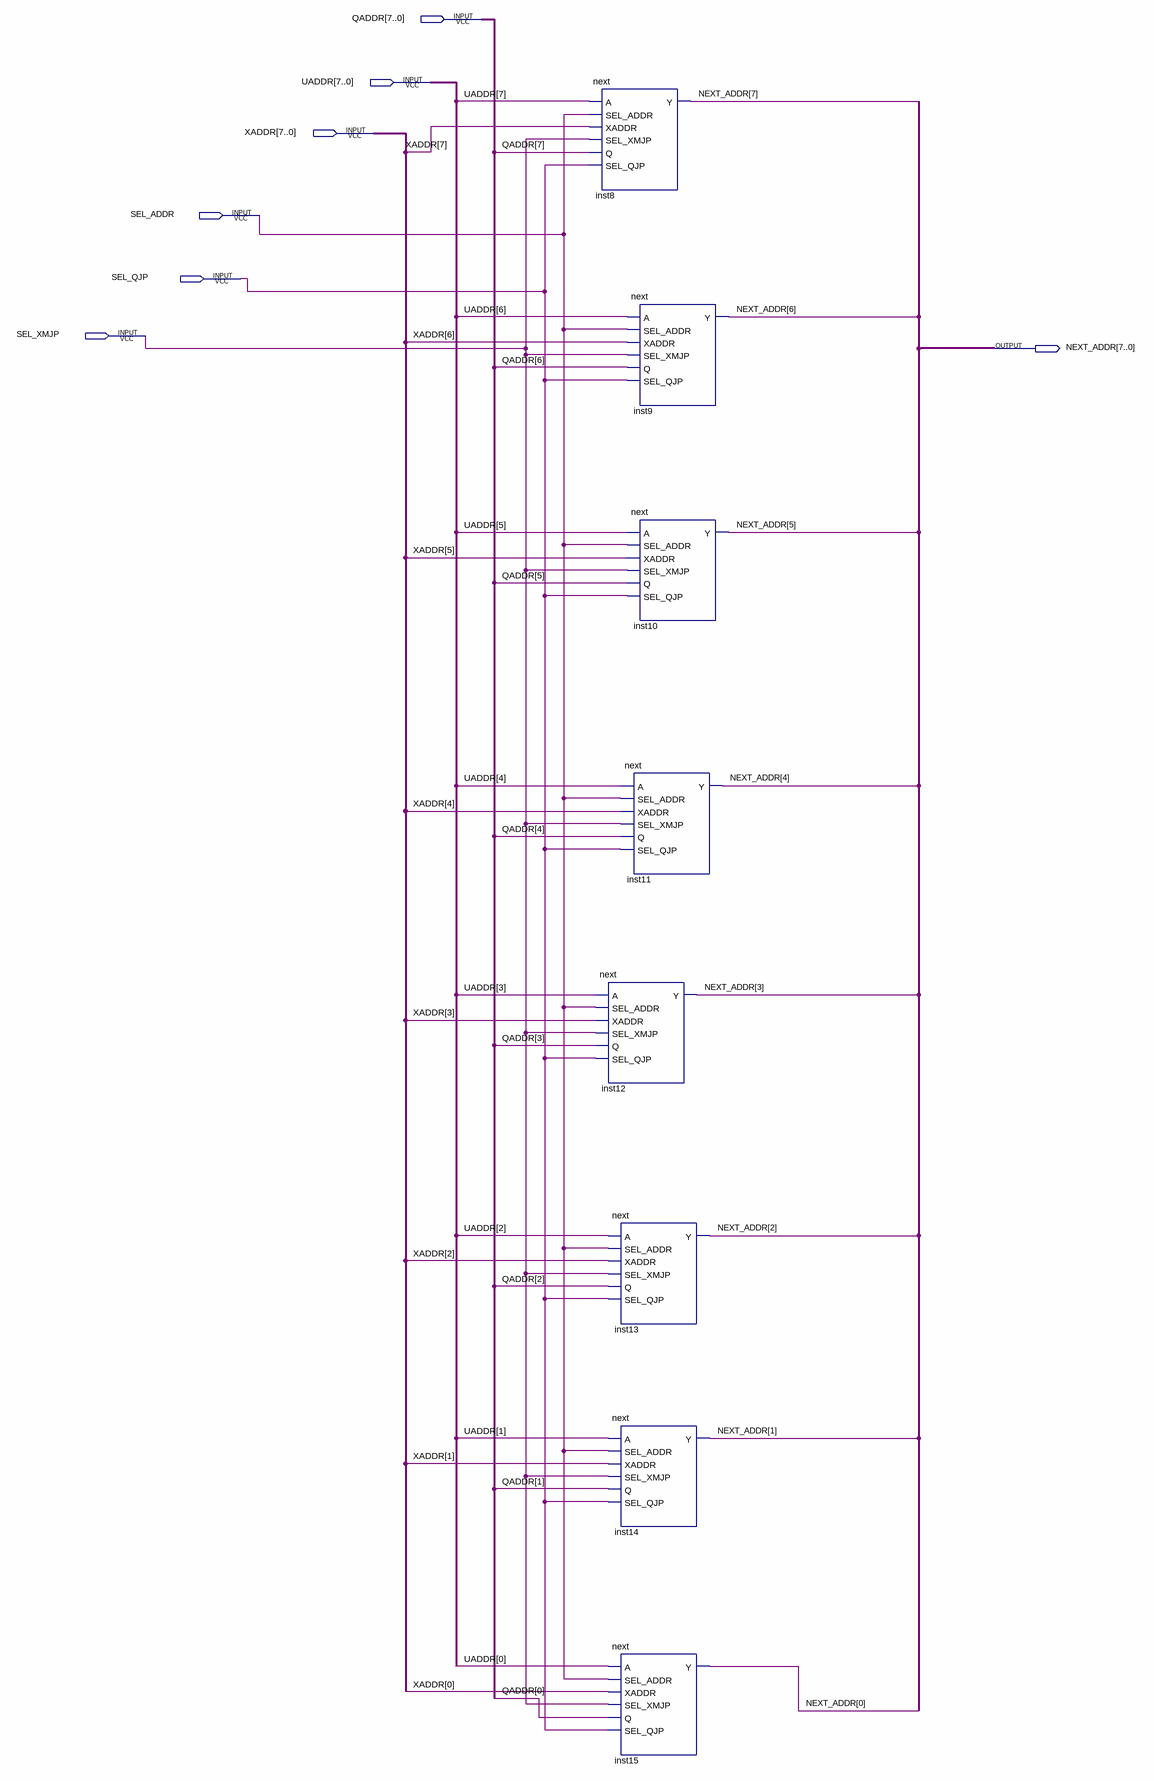
[diagram p0: schematic sheet]
// Quartus schematic next8bit_hxg.bdf as structural Verilog: 8 symbols, 7 pins
module next8bit_hxg (
  input  [7:0] QADDR,
  input  [7:0] UADDR,
  input  [7:0] XADDR,
  input  SEL_ADDR,
  input  SEL_QJP,
  input  SEL_XMJP,
  output [7:0] NEXT_ADDR
);

  next inst8 (
    .A(UADDR[7]), .SEL_ADDR(SEL_ADDR), .XADDR(XADDR[7]), .SEL_XMJP(SEL_XMJP), .Q(QADDR[7]),
    .SEL_QJP(SEL_QJP), .Y(NEXT_ADDR[7]));
  next inst9 (
    .A(UADDR[6]), .SEL_ADDR(SEL_ADDR), .XADDR(XADDR[6]), .SEL_XMJP(SEL_XMJP), .Q(QADDR[6]),
    .SEL_QJP(SEL_QJP), .Y(NEXT_ADDR[6]));
  next inst10 (
    .A(UADDR[5]), .SEL_ADDR(SEL_ADDR), .XADDR(XADDR[5]), .SEL_XMJP(SEL_XMJP), .Q(QADDR[5]),
    .SEL_QJP(SEL_QJP), .Y(NEXT_ADDR[5]));
  next inst11 (
    .A(UADDR[4]), .SEL_ADDR(SEL_ADDR), .XADDR(XADDR[4]), .SEL_XMJP(SEL_XMJP), .Q(QADDR[4]),
    .SEL_QJP(SEL_QJP), .Y(NEXT_ADDR[4]));
  next inst12 (
    .A(UADDR[3]), .SEL_ADDR(SEL_ADDR), .XADDR(XADDR[3]), .SEL_XMJP(SEL_XMJP), .Q(QADDR[3]),
    .SEL_QJP(SEL_QJP), .Y(NEXT_ADDR[3]));
  next inst13 (
    .A(UADDR[2]), .SEL_ADDR(SEL_ADDR), .XADDR(XADDR[2]), .SEL_XMJP(SEL_XMJP), .Q(QADDR[2]),
    .SEL_QJP(SEL_QJP), .Y(NEXT_ADDR[2]));
  next inst14 (
    .A(UADDR[1]), .SEL_ADDR(SEL_ADDR), .XADDR(XADDR[1]), .SEL_XMJP(SEL_XMJP), .Q(QADDR[1]),
    .SEL_QJP(SEL_QJP), .Y(NEXT_ADDR[1]));
  next inst15 (
    .A(UADDR[0]), .SEL_ADDR(SEL_ADDR), .XADDR(XADDR[0]), .SEL_XMJP(SEL_XMJP), .Q(QADDR[0]),
    .SEL_QJP(SEL_QJP), .Y(NEXT_ADDR[0]));
endmodule
